# Altium schematic sheet Schematic.SchDoc
size A4; SheetNumber: 1; SheetTotal: 1
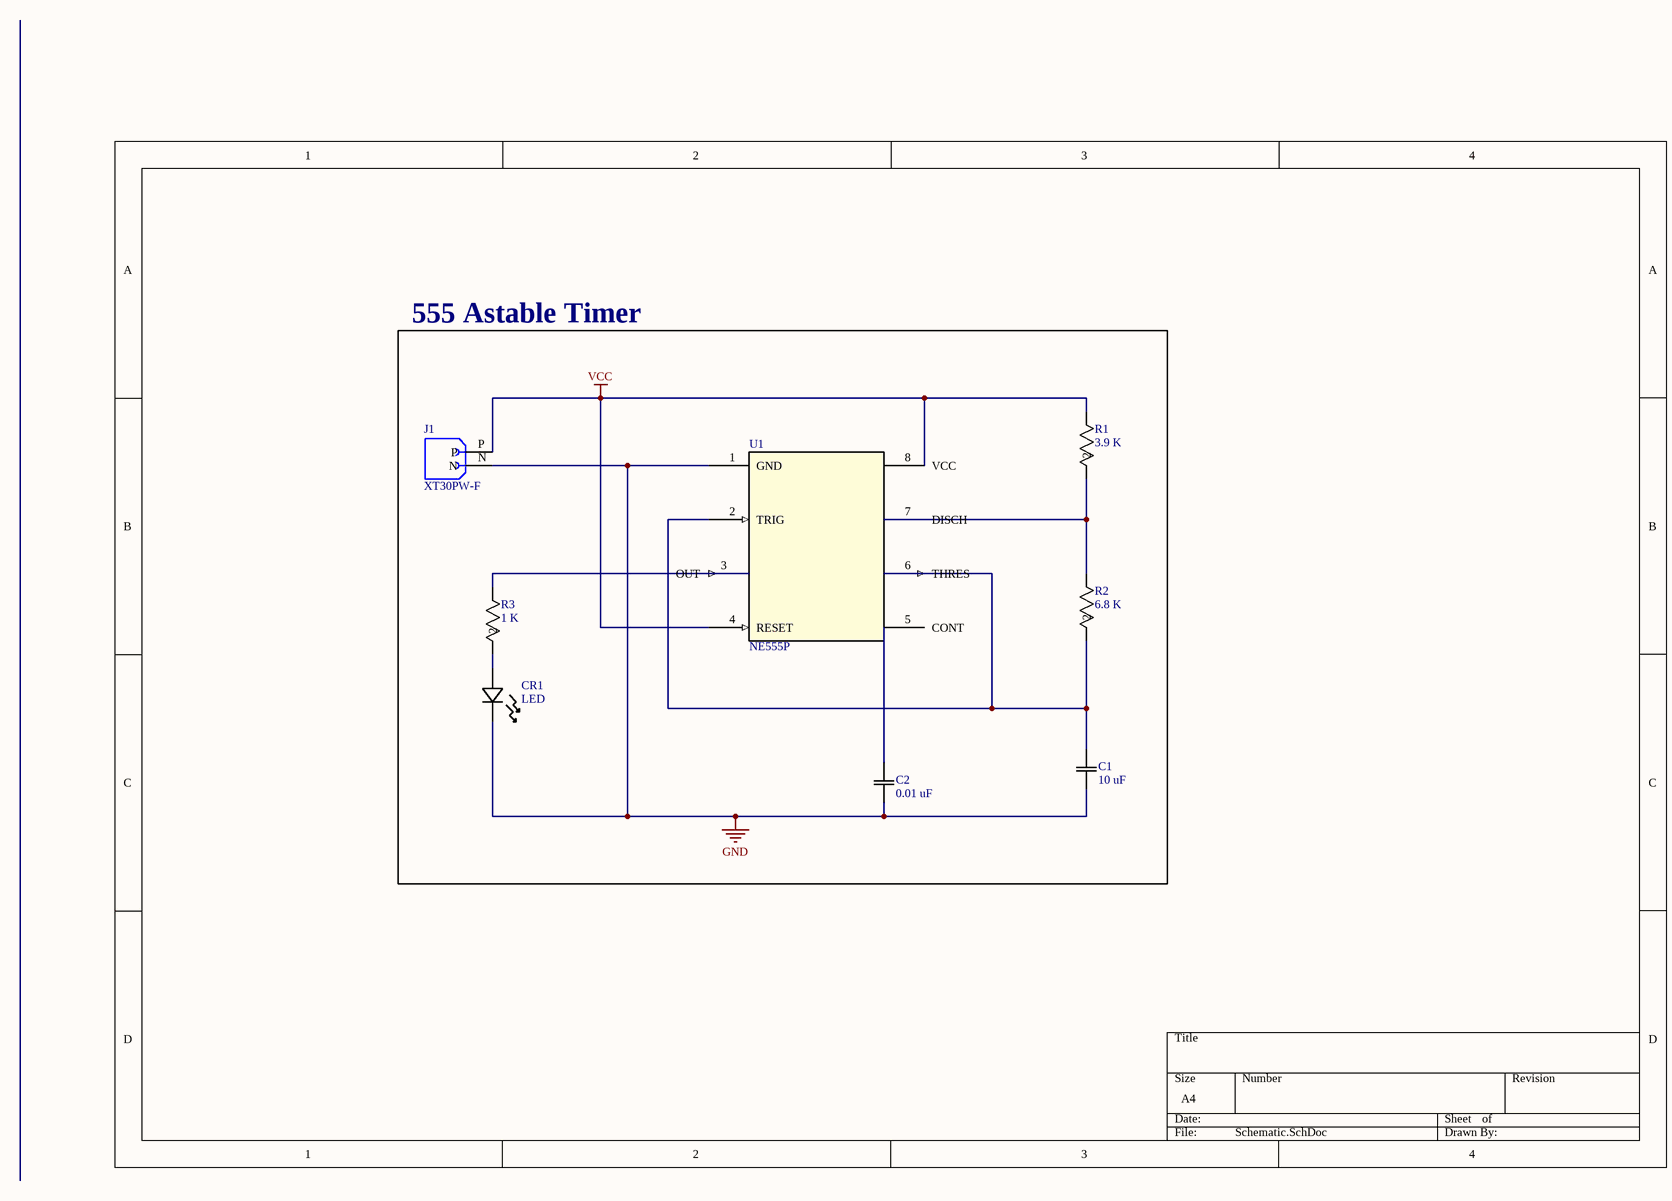
[diagram p0: Schematic.SchDoc]

## Parts
C1  10 uF  [CAP_2012_TDK]
C2  0.01 uF  [CAP_ECWU_E1_PAN]
CR1  LED  [LED_DIALIGHT_598_DIA]
J1  XT30PW-F  [AMASS_XT30PW-F]
R1  3.9 K  [RC0603N_PAN]
R2  6.8 K  [RC2512N_PAN]
R3  1 K  [RC1206N_PAN]
U1  NE555P  [P8]

## Blocks framed on the sheet
555 Astable Timer: C1 C2 CR1 J1 R1-R3 U1

## Nets
GND: C1.1 C2.1 CR1.1 J1.N U1.1(GND)
VCC: J1.P R1.1 U1.4(RESET)
NetC1_2: C1.2 R2.2 U1.2(TRIG) U1.6(THRES)
NetC2_2: C2.2 U1.5(CONT)
NetCR1_2: CR1.2 R3.2
NetR1_2: R1.2 R2.1 U1.7(DISCH)
NetR3_1: R3.1 U1.3(OUT)

Not connected (* = marked no-connect by the designer): U1 8(VCC)

## Library data of the parts
C1 = C2012X5R1C106K085AC: Description; Manufacturer_Name: TDK; Copyright: Copyright (C) 2025 Ultra Librarian. All rights reserved.; Manufacturer_Part_Number: C2012X5R1C106K085AC
C2 = ECW-U2103KC9: Description; Manufacturer_Name: Panasonic; Copyright: Copyright (C) 2026 Ultra Librarian. All rights reserved.; Manufacturer_Part_Number: ECW-U2103KC9
CR1 = 598-8050-107F: Description; Manufacturer_Name: Dialight; Copyright: Copyright (C) 2026 Ultra Librarian. All rights reserved.; Manufacturer_Part_Number: 598-8050-107F
J1 = XT30PW-F: Socket; DC supply; XT30; female; PIN: 2; on PCBs; THT; yellow; 15A; MF: amass; SnapEDA_Link: https://www.snapeda.com/parts/XT30PW-F/AMASS/view-part/?ref=snap; Package: None; Value: *; MP: XT30PW-F; Check_prices: https://www.snapeda.com/parts/XT30PW-F/AMASS/view-part/?ref=eda
R1 = ERJ-3GEYJ392V: No Description Available; Manufacturer_Name: Panasonic; Copyright: Copyright (C) 2026 Ultra Librarian. All rights reserved.; Manufacturer_Part_Number: ERJ-3GEYJ392V
R2 = ERJ-1TYJ683U: Description; Manufacturer_Name: Panasonic; Copyright: Copyright (C) 2025 Ultra Librarian. All rights reserved.; Manufacturer_Part_Number: ERJ-1TYJ683U
R3 = ERJ-P08J102V: Description; Manufacturer_Name: Panasonic; Copyright: Copyright (C) 2025 Ultra Librarian. All rights reserved.; Manufacturer_Part_Number: ERJ-P08J102V
U1 = NE555P: Single Precision Timer 8-PDIP 0 to 70; Manufacturer_Name: Texas Instruments; Copyright: Copyright (C) 2025 Ultra Librarian. All rights reserved.; Manufacturer_Part_Number: NE555P; RefDes: RefDes; Type: Type